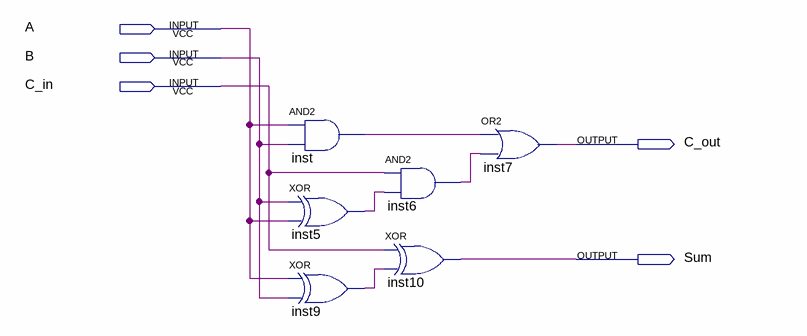
[diagram p0: schematic sheet]
// Quartus schematic FAddr.bdf as structural Verilog: 6 symbols, 5 pins
module FAddr (
  input  A,
  input  B,
  input  C_in,
  output C_out,
  output Sum
);

  wire inst5_out, inst6_out, inst9_out, inst_out;

  and inst (inst_out, A, B);
  xor inst5 (inst5_out, B, A);
  xor inst9 (inst9_out, A, B);
  and inst6 (inst6_out, C_in, inst5_out);
  xor inst10 (Sum, C_in, inst9_out);
  or inst7 (C_out, inst_out, inst6_out);
endmodule
